# Altium schematic sheet a0206-2006.SchDoc
size A
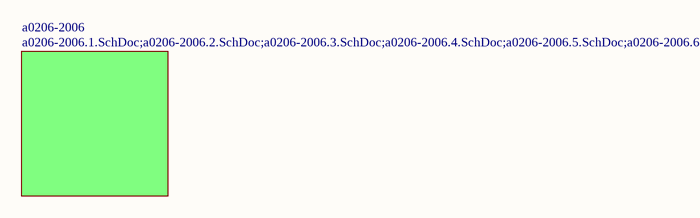
[diagram p0: a0206-2006.SchDoc]

## Sub-sheets
a0206-2006 = a0206-2006.1.SchDoc;a0206-2006.2.SchDoc;a0206-2006.3.SchDoc;a0206-2006.4.SchDoc;a0206-2006.5.SchDoc;a0206-2006.6.SchDoc;a0206-2006.7.SchDoc;a0206-2006.8.SchDoc;a0206-2006.9.SchDoc;a0206-2006.10.SchDoc;a0206-2006.11.SchDoc;a0206-2006.12.SchDoc;a0206-2006.13.SchDoc;a0206-2006.14.SchDoc;a0206-2006.15.SchDoc;a0206-2006.16.SchDoc;a0206-2006.17.SchDoc: no entries